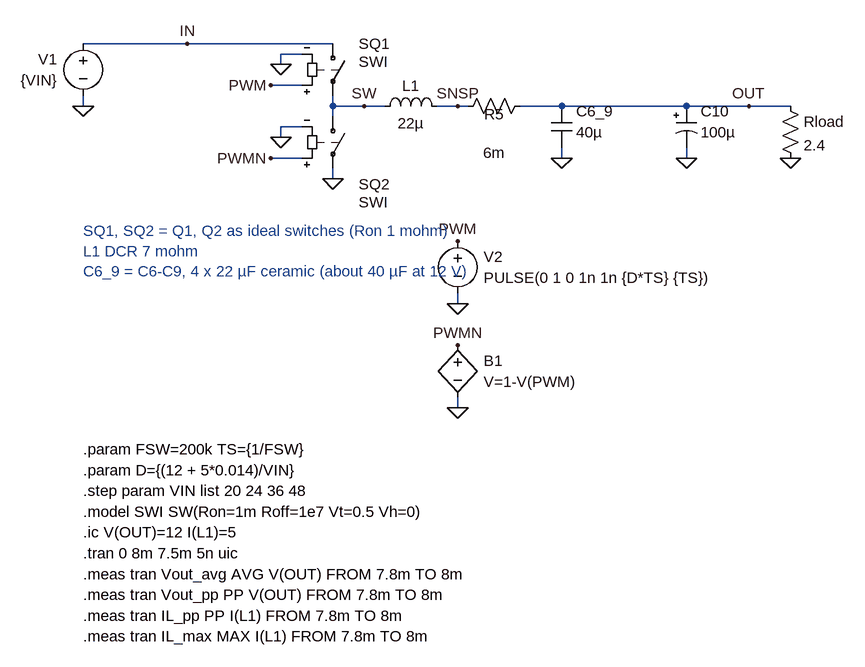
[diagram p0: schematic 01_powerstage_ideal.asc]
01_powerstage_ideal.asc, the LTspice schematic file:
Version 4
SHEET 1 1600 900
SYMBOL voltage -288 -16 R0
WINDOW 0 -40 40 Right 2
WINDOW 3 -40 72 Right 2
SYMATTR InstName V1
SYMATTR Value {VIN}
WIRE -288 0 96 0
FLAG -128 0 IN
WIRE -288 80 -288 96
FLAG -288 96 0
SYMBOL sw 96 -16 R0
WINDOW 0 40 16 Left 2
WINDOW 3 40 44 Left 2
SYMATTR InstName SQ1
SYMATTR Value SWI
SYMBOL sw 96 96 R0
WINDOW 0 40 120 Left 2
WINDOW 3 40 148 Left 2
SYMATTR InstName SQ2
SYMATTR Value SWI
WIRE 96 80 96 112
WIRE 96 96 176 96
FLAG 144 96 SW
WIRE 96 192 96 208
FLAG 96 208 0
WIRE 48 64 0 64
FLAG 0 64 PWM
WIRE 48 16 16 16
WIRE 16 16 16 32
FLAG 16 32 0
WIRE 48 176 0 176
FLAG 0 176 PWMN
WIRE 48 128 16 128
WIRE 16 128 16 144
FLAG 16 144 0
SYMBOL voltage 288 288 R0
WINDOW 0 40 40 Left 2
WINDOW 3 40 72 Left 2
SYMATTR InstName V2
SYMATTR Value PULSE(0 1 0 1n 1n {D*TS} {TS})
WIRE 288 384 288 400
FLAG 288 400 0
FLAG 288 304 PWM
SYMBOL bv 288 448 R0
WINDOW 0 40 40 Left 2
WINDOW 3 40 72 Left 2
SYMATTR InstName B1
SYMATTR Value V=1-V(PWM)
WIRE 288 544 288 560
FLAG 288 560 0
FLAG 288 464 PWMN
SYMBOL ind 160 112 R270
WINDOW 0 32 56 VTop 2
WINDOW 3 5 56 VBottom 2
SYMATTR InstName L1
SYMATTR Value 22µ
SYMATTR SpiceLine Rser=7m
WIRE 256 96 304 96
FLAG 288 96 SNSP
SYMBOL res 288 112 R270
WINDOW 0 -12 56 VTop 2
WINDOW 3 -40 56 VBottom 2
SYMATTR InstName R5
SYMATTR Value 6m
WIRE 384 96 800 96
FLAG 736 96 OUT
SYMBOL cap 432 96 R0
WINDOW 0 38 8 Left 2
WINDOW 3 38 40 Left 2
SYMATTR InstName C6_9
SYMATTR Value 40µ
SYMATTR SpiceLine Rser=0.75m
WIRE 448 160 448 176
FLAG 448 176 0
SYMBOL polcap 624 96 R0
WINDOW 0 38 8 Left 2
WINDOW 3 38 40 Left 2
SYMATTR InstName C10
SYMATTR Value 100µ
SYMATTR SpiceLine Rser=36m
WIRE 640 160 640 176
FLAG 640 176 0
SYMBOL res 784 80 R0
SYMATTR InstName Rload
SYMATTR Value 2.4
FLAG 800 176 0
TEXT -288 288 Left 2 ;SQ1, SQ2 = Q1, Q2 as ideal switches (Ron 1 mohm)\nL1 DCR 7 mohm\nC6_9 = C6-C9, 4 x 22 µF ceramic (about 40 µF at 12 V)
TEXT -288 624 Left 2 !.param FSW=200k TS={1/FSW}
TEXT -288 656 Left 2 !.param D={(12 + 5*0.014)/VIN}
TEXT -288 688 Left 2 !.step param VIN list 20 24 36 48
TEXT -288 720 Left 2 !.model SWI SW(Ron=1m Roff=1e7 Vt=0.5 Vh=0)
TEXT -288 752 Left 2 !.ic V(OUT)=12 I(L1)=5
TEXT -288 784 Left 2 !.tran 0 8m 7.5m 5n uic
TEXT -288 816 Left 2 !.meas tran Vout_avg AVG V(OUT) FROM 7.8m TO 8m
TEXT -288 848 Left 2 !.meas tran Vout_pp PP V(OUT) FROM 7.8m TO 8m
TEXT -288 880 Left 2 !.meas tran IL_pp PP I(L1) FROM 7.8m TO 8m
TEXT -288 912 Left 2 !.meas tran IL_max MAX I(L1) FROM 7.8m TO 8m

The netlist it stands for:
* 01_powerstage_ideal.asc
V1 IN 0 {VIN}
SQ1 IN SW PWM 0 SWI
SQ2 SW 0 PWMN 0 SWI
V2 PWM 0 PULSE(0 1 0 1n 1n {D*TS} {TS})
B1 PWMN 0 V=1-V(PWM)
L1 SW SNSP 22µ Rser=7m
R5 SNSP OUT 6m
C6_9 OUT 0 40µ Rser=0.75m
C10 OUT 0 100µ Rser=36m
Rload OUT 0 2.4
* SQ1, SQ2 = Q1, Q2 as ideal switches (Ron 1 mohm)
* L1 DCR 7 mohm
* C6_9 = C6-C9, 4 x 22 µF ceramic (about 40 µF at 12 V)
.param FSW=200k TS={1/FSW}
.param D={(12 + 5*0.014)/VIN}
.step param VIN list 20 24 36 48
.model SWI SW(Ron=1m Roff=1e7 Vt=0.5 Vh=0)
.ic V(OUT)=12 I(L1)=5
.tran 0 8m 7.5m 5n uic
.meas tran Vout_avg AVG V(OUT) FROM 7.8m TO 8m
.meas tran Vout_pp PP V(OUT) FROM 7.8m TO 8m
.meas tran IL_pp PP I(L1) FROM 7.8m TO 8m
.meas tran IL_max MAX I(L1) FROM 7.8m TO 8m
.backanno
.end